# Altium schematic sheet 07 HDMI.SchDoc
size A3; Revision: V1.2; SheetNumber: 7; SheetTotal: 11
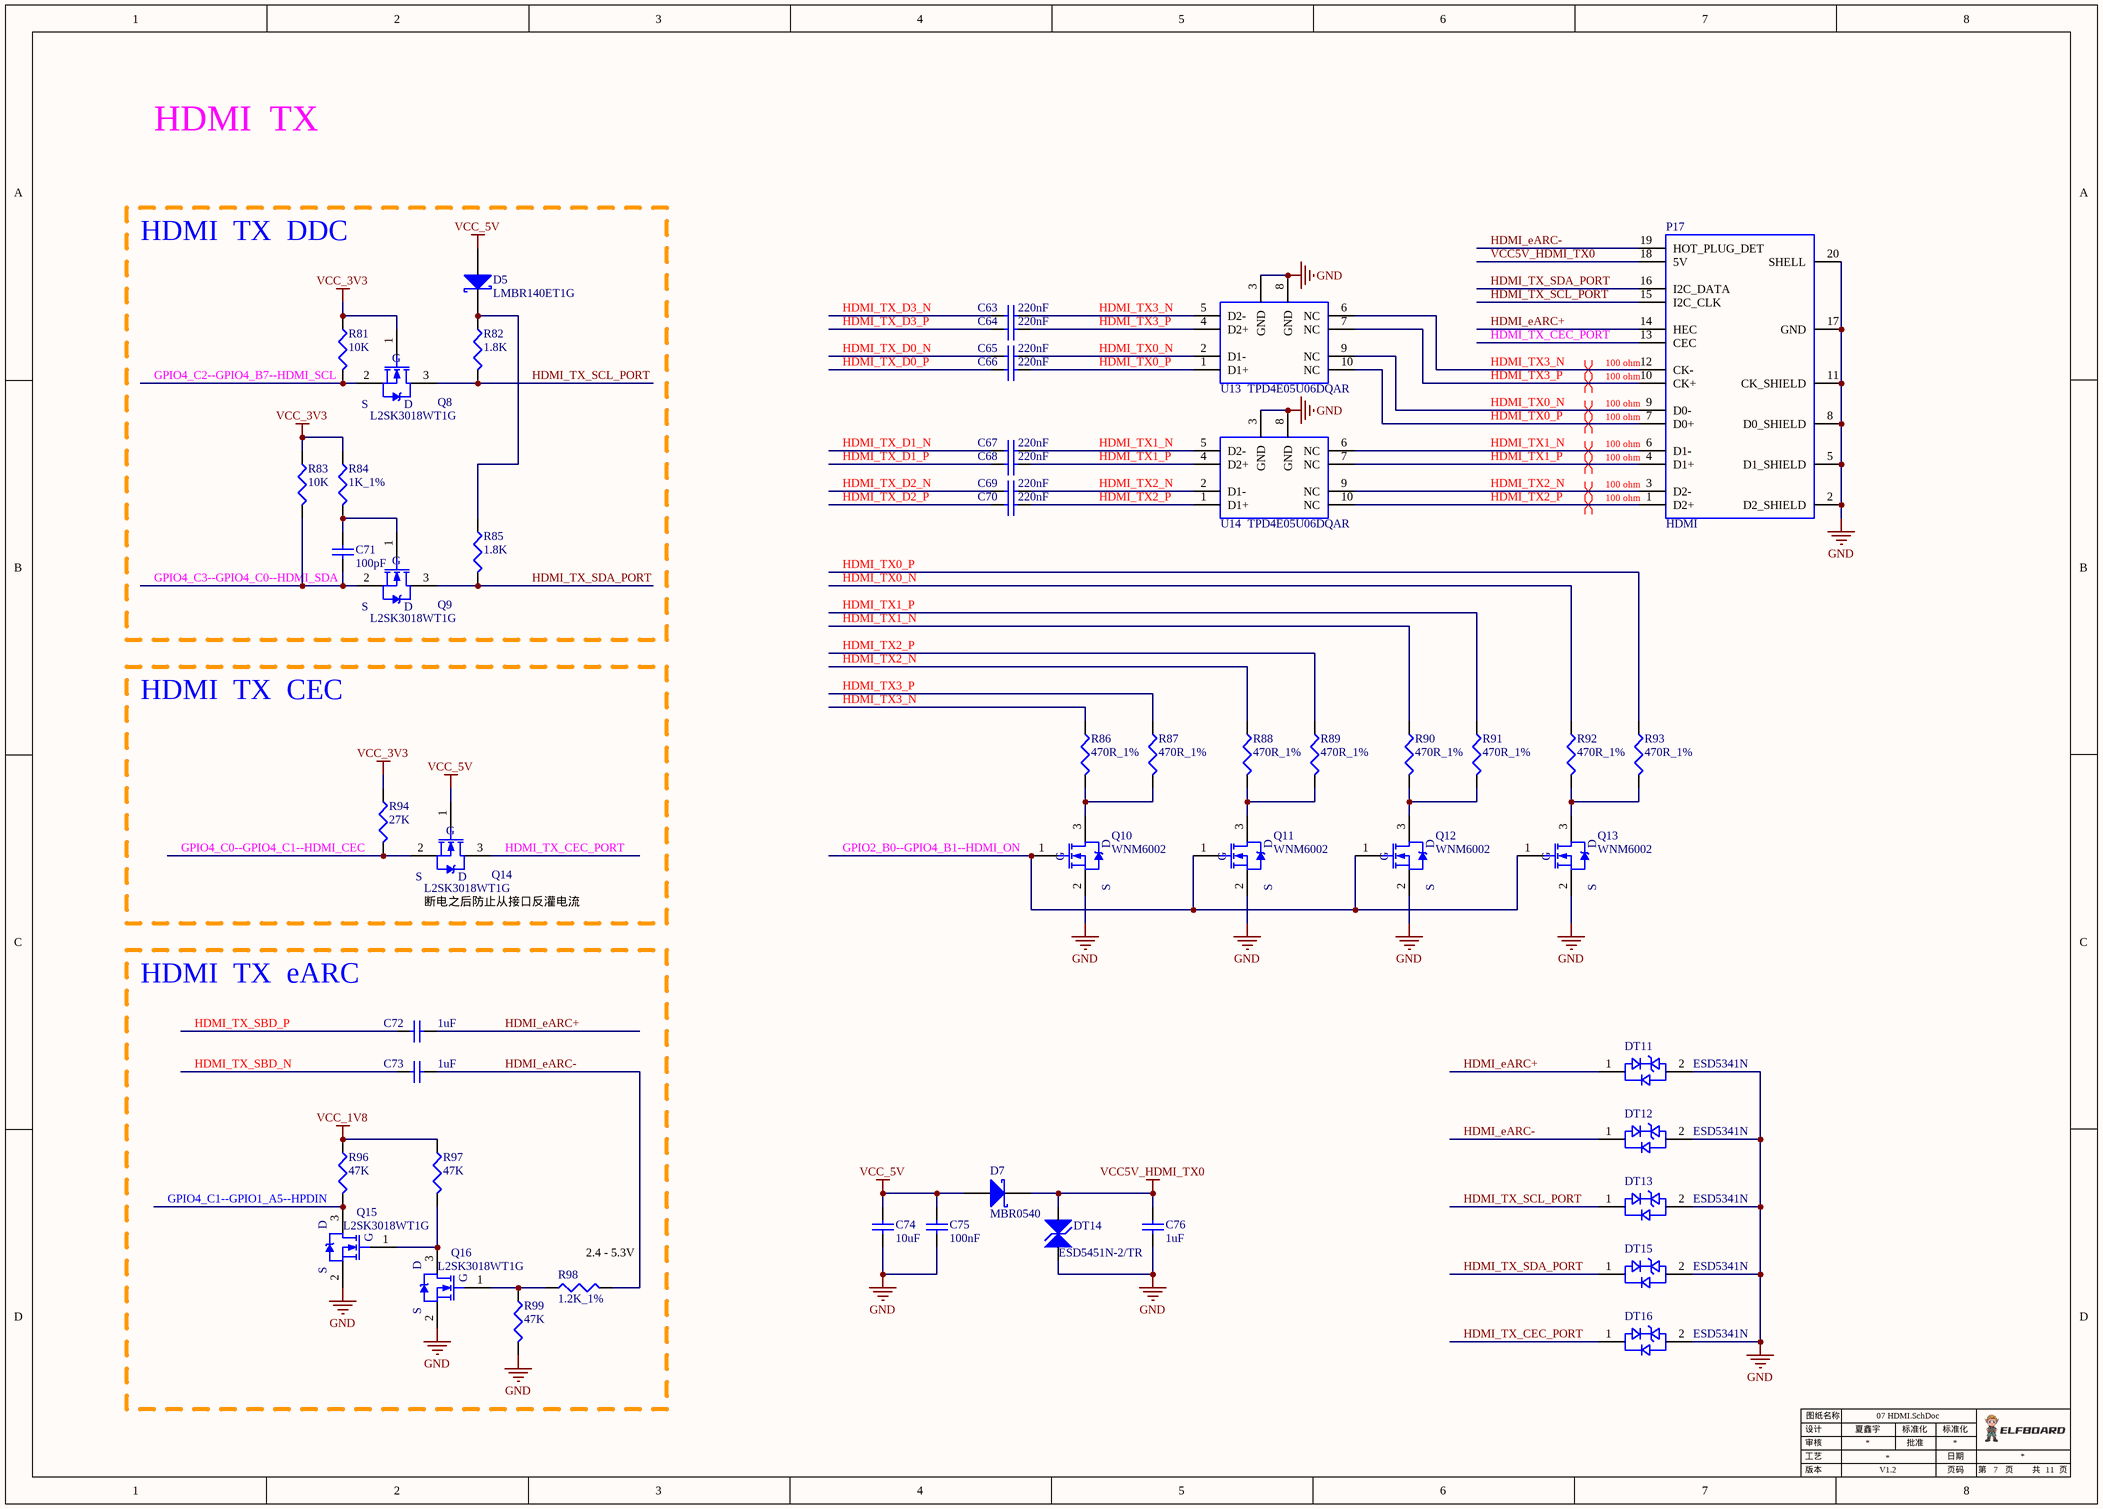
[diagram p0: 07 HDMI.SchDoc]

## Parts
C63  220nF  [0201C]
C64  220nF  [0201C]
C65  220nF  [0201C]
C66  220nF  [0201C]
C67  220nF  [0201C]
C68  220nF  [0201C]
C69  220nF  [0201C]
C70  220nF  [0201C]
C71  100pF  [0402C]
C72  1uF  [0201C]
C73  1uF  [0201C]
C74  10uF  [0603C]
C75  100nF  [0603C]
C76  1uF  [0402C]
D5  LMBR140ET1G  [SOD_323]
D7  MBR0540  [SOD_123]
DT11  ESD5341N  [0402TVS-ESD5341N]
DT12  ESD5341N  [0402TVS-ESD5341N]
DT13  ESD5341N  [0402TVS-ESD5341N]
DT14  ESD5451N-2/TR  [0402TVS]
DT15  ESD5341N  [0402TVS-ESD5341N]
DT16  ESD5341N  [0402TVS-ESD5341N]
P17  HDMI  [HDMI]
Q8  L2SK3018WT1G  [SOT323]
Q9  L2SK3018WT1G  [SOT323]
Q10  WNM6002  [SOT_323]
Q11  WNM6002  [SOT_323]
Q12  WNM6002  [SOT_323]
Q13  WNM6002  [SOT_323]
Q14  L2SK3018WT1G  [SOT323]
Q15  L2SK3018WT1G  [SOT323]
Q16  L2SK3018WT1G  [SOT323]
R81  10K  [0402R]
R82  1.8K  [0402R]
R83  10K  [0402R]
R84  1K_1%  [0402R]
R85  1.8K  [0402R]
R86  470R_1%  [0201R]
R87  470R_1%  [0201R]
R88  470R_1%  [0201R]
R89  470R_1%  [0201R]
R90  470R_1%  [0201R]
R91  470R_1%  [0201R]
R92  470R_1%  [0201R]
R93  470R_1%  [0201R]
R94  27K  [0402R]
R96  47K  [0402R]
R97  47K  [0402R]
R98  1.2K_1%  [0402R]
R99  47K  [0402R]
U13  TPD4E05U06DQAR  [USON-10]
U14  TPD4E05U06DQAR  [USON-10]

## Nets
GND: C74.1 C75.1 C76.1 DT11.2 DT12.2 DT13.2 DT14.1 DT15.2 DT16.2 P17.2(D2_SHIELD) P17.5(D1_SHIELD) P17.8(D0_SHIELD) P17.11(CK_SHIELD) P17.17(GND) P17.20(SHELL) Q10.2(S) Q11.2(S) Q12.2(S) Q13.2(S) Q15.2(S) Q16.2(S) R99.2 U13.3(GND) U13.8(GND) U14.3(GND) U14.8(GND)
VCC5V_HDMI_TX0: C76.2 D7.2(K) DT14.2 P17.18(5V)
VCC_1V8: R96.1 R97.1
VCC_3V3: Q8.1(G) R81.1 R83.1 R84.1 R94.1
VCC_5V: C74.2 C75.2 D5.1(A) D7.1(A) Q14.1(G)
GPIO2_B0--GPIO4_B1--HDMI_ON: Q10.1(G) Q11.1(G) Q12.1(G) Q13.1(G)
GPIO4_C0--GPIO4_C1--HDMI_CEC: Q14.2(S) R94.2
GPIO4_C1--GPIO1_A5--HPDIN: Q15.3(D) R96.2
GPIO4_C2--GPIO4_B7--HDMI_SCL: Q8.2(S) R81.2
GPIO4_C3--GPIO4_C0--HDMI_SDA: C71.1 Q9.2(S) R83.2
HDMI_eARC+: C72.2 DT11.1 P17.14(HEC)
HDMI_eARC-: C73.2 DT12.1 P17.19(HOT_PLUG_DET) R98.2
HDMI_TX0_N: C65.2 P17.9(D0-) R92.1 U13.2(D1-) U13.9(NC)
HDMI_TX0_P: C66.2 P17.7(D0+) R93.1 U13.1(D1+) U13.10(NC)
HDMI_TX1_N: C67.2 P17.6(D1-) R90.1 U14.5(D2-) U14.6(NC)
HDMI_TX1_P: C68.2 P17.4(D1+) R91.1 U14.4(D2+) U14.7(NC)
HDMI_TX2_N: C69.2 P17.3(D2-) R88.1 U14.2(D1-) U14.9(NC)
HDMI_TX2_P: C70.2 P17.1(D2+) R89.1 U14.1(D1+) U14.10(NC)
HDMI_TX3_N: C63.2 P17.12(CK-) R86.1 U13.5(D2-) U13.6(NC)
HDMI_TX3_P: C64.2 P17.10(CK+) R87.1 U13.4(D2+) U13.7(NC)
HDMI_TX_CEC_PORT: DT16.1 P17.13(CEC) Q14.3(D)
HDMI_TX_D0_N: C65.1
HDMI_TX_D0_P: C66.1
HDMI_TX_D1_N: C67.1
HDMI_TX_D1_P: C68.1
HDMI_TX_D2_N: C69.1
HDMI_TX_D2_P: C70.1
HDMI_TX_D3_N: C63.1
HDMI_TX_D3_P: C64.1
HDMI_TX_SBD_N: C73.1
HDMI_TX_SBD_P: C72.1
HDMI_TX_SCL_PORT: DT13.1 P17.15(I2C_CLK) Q8.3(D) R82.2
HDMI_TX_SDA_PORT: DT15.1 P17.16(I2C_DATA) Q9.3(D) R85.2
NetC71_2: C71.2 Q9.1(G) R84.2
NetD5_2: D5.2(K) R82.1 R85.1
NetQ10_3: Q10.3(D) R86.2 R87.2
NetQ11_3: Q11.3(D) R88.2 R89.2
NetQ12_3: Q12.3(D) R90.2 R91.2
NetQ13_3: Q13.3(D) R92.2 R93.2
NetQ15_1: Q15.1(G) Q16.3(D) R97.2
NetQ16_1: Q16.1(G) R98.1 R99.1

## Layout directives
differential pair; differential pair class 100 ohm: HDMI_TX0_N, HDMI_TX0_P, HDMI_TX1_N, HDMI_TX1_P, HDMI_TX2_N, HDMI_TX2_P, HDMI_TX3_N, HDMI_TX3_P

## Notes on the sheet
- HDMI  TX
- HDMI  TX  DDC
- HDMI  TX  CEC
- (near Q14) 断电之后防止从接口反灌电流
- HDMI  TX  eARC
- (near R98) 2.4 - 5.3V
- 设计
- 审核
- 工艺
- 图纸名称
- 夏鑫宇
- 批准
- 标准化
- 日期
- 版本
- 页码
- 第
- 页
- 共

## Library data of the parts
C63-C70 = 1110201001: 序号: 928; 存货名称: 贴装叠层陶瓷电容; 规格型号: 0201,220nF,6.3V,±20％,X5R; Published: 8-Jun-2000; LatestRevisionDate: 17-Jul-2002; LatestRevisionNote: Re-released for DXP Platform.; PackageReference: RAD-0.3; Publisher: Altium Limited; PackageDescription: Radial Cap, Thru-Hole; 2 Leads; 0.3 in Pin Spacing; Value: 220nF; 存货编码: 1110201001
C71 = 1110202016: 序号: 587; 存货名称: 贴装叠层陶瓷电容; 规格型号: 0402,100pF,50V,±5％,NPO; Published: 8-Jun-2000; LatestRevisionDate: 17-Jul-2002; LatestRevisionNote: Re-released for DXP Platform.; PackageReference: RAD-0.3; Publisher: Altium Limited; PackageDescription: Radial Cap, Thru-Hole; 2 Leads; 0.3 in Pin Spacing; Value: 100pF; 存货编码: 1110202016
C72 C73 = 1110201015: 存货名称: 贴装叠层陶瓷电容; 规格型号: 0201,1uF,10V,±20％,X5R; Published: 8-Jun-2000; LatestRevisionDate: 17-Jul-2002; LatestRevisionNote: Re-released for DXP Platform.; PackageReference: RAD-0.3; Publisher: Altium Limited; PackageDescription: Radial Cap, Thru-Hole; 2 Leads; 0.3 in Pin Spacing; Value: 1uF; 存货编码: 1110201015
C74 = 1110203058: 序号: 707; 存货名称: 贴装叠层陶瓷电容; 规格型号: 0603,10uF,10V,±10％,X5R; 禁用状态: 否; Published: 8-Jun-2000; LatestRevisionDate: 17-Jul-2002; LatestRevisionNote: Re-released for DXP Platform.; PackageReference: RAD-0.3; Publisher: Altium Limited; PackageDescription: Radial Cap, Thru-Hole; 2 Leads; 0.3 in Pin Spacing; Value: 10uF; 存货编码: 1110203058
C75 = 1110203001: 序号: 628; 存货名称: 贴装叠层陶瓷电容; 规格型号: 0603,100nF,50V,±10％,X7R; 禁用状态: 否; Published: 8-Jun-2000; LatestRevisionDate: 17-Jul-2002; LatestRevisionNote: Re-released for DXP Platform.; PackageReference: RAD-0.3; Publisher: Altium Limited; PackageDescription: Radial Cap, Thru-Hole; 2 Leads; 0.3 in Pin Spacing; Value: 100nF; 存货编码: 1110203001
C76 = 1110202021: 序号: 600; 存货名称: 贴装叠层陶瓷电容; 规格型号: 0402,1uF,16V,±10％,X5R; Published: 8-Jun-2000; LatestRevisionDate: 17-Jul-2002; LatestRevisionNote: Re-released for DXP Platform.; PackageReference: RAD-0.3; Publisher: Altium Limited; PackageDescription: Radial Cap, Thru-Hole; 2 Leads; 0.3 in Pin Spacing; Value: 1uF; 存货编码: 1110202021
D5 = 1110501064: 存货名称: 肖特基二极管; 规格型号: LMBR140ET1G,SOD323; Published: 8-Jun-2000; LatestRevisionDate: 17-Jul-2002; LatestRevisionNote: Re-released for DXP Platform.; PackageReference: SMB; Publisher: Altium Limited; PackageDescription: DO-214-AA/SMB; 2 C-Bend Leads; Body 5.3 x 3.6 mm, inc. leads (LxW); Code_JEDEC: DO-214-AA; 存货编码: 1110501064; Value: LMBR140ET1G
D7 = 1110501001: 序号: 2480; 存货名称: 肖特基二极管; 规格型号: MBR0540,SOD123; Published: 8-Jun-2000; LatestRevisionDate: 17-Jul-2002; LatestRevisionNote: Re-released for DXP Platform.; PackageReference: SMB; Publisher: Altium Limited; PackageDescription: DO-214-AA/SMB; 2 C-Bend Leads; Body 5.3 x 3.6 mm, inc. leads (LxW); Code_JEDEC: DO-214-AA; 存货编码: 1110501001; Value: MBR0540
DT11-DT13 DT15 DT16 = 1110503052: 序号: 4824; 存货名称: TVS管; 规格型号: ESD5341N-2/TR,0402TVS; value: ESD5341N-2/TR; 禁用状态: 否; 存货编码: 1110503052
DT14 = 1110503036: 存货名称: TVS管; 规格型号: ESD5451N-2/TR,DFN1006-2L; 禁用状态: 否; Value: ESD5451N-2/TR; 存货编码: 1110503036
P17 = 1120202041: 序号: 2494; 存货名称: 插装HDMI座; 规格型号: A型; 描述: FCI生产编号:10029449,001RLF,与1120202030通用; 禁用状态: 否; 存货编码: 1120202041; value: HDMI
Q8 Q9 Q14-Q16 = 1110505029: Note: Pin 2 is electrically connected to pin 4.; 序号: 4061; 存货名称: 场效应管; 规格型号: L2SK3018WT1G,SOT-323; 描述: 替代1110505016; 禁用状态: 否; Published: 8-Jun-2000; LatestRevisionDate: 17-Jul-2002; LatestRevisionNote: Re-released for DXP Platform.; DatasheetVersion: PD-9.814; PackageVersion: Feb-1997; PackageReference: TO-220AB; Publisher: Altium Limited; PackageDescription: TO, Thru-Hole, Vertical, Heatsink Mounted; 3 In-Line Leads; Pitch 2.54 mm; VALUE: L2SK3018WT1G; 存货编码: 1110505029
Q10-Q13 = 1110505033: Note: Pin 2 is electrically connected to pin 4.; 序号: 4825; 存货名称: 场效应管; 规格型号: WNM6002,SOT_323,N沟道; 禁用状态: 否; Published: 8-Jun-2000; LatestRevisionDate: 17-Jul-2002; LatestRevisionNote: Re-released for DXP Platform.; DatasheetVersion: PD-9.814; PackageVersion: Feb-1997; PackageReference: TO-220AB; Publisher: Altium Limited; PackageDescription: TO, Thru-Hole, Vertical, Heatsink Mounted; 3 In-Line Leads; Pitch 2.54 mm; VALUE: WNM6002; 存货编码: 1110505033
R81 R83 = 1110102007: 序号: 17; 存货名称: 贴装电阻; 规格型号: 0402,10K,±5％; Value: 10K; 存货编码: 1110102007
R82 R85 = 1110102185: 存货名称: 贴装电阻; 规格型号: 0402,1.8K,±5％; 描述栏信息: 厚声; Value: 1.8K; 存货编码: 1110102185
R84 = 1110102011: 序号: 21; 存货名称: 贴装电阻; 规格型号: 0402,1K,±1％; Value: 1K_1%; 存货编码: 1110102011
R86-R93 = 1110101007: 存货名称: 贴装电阻; 规格型号: 0201,470Ω,±1％; Value: 470R_1%; 存货编码: 1110101007
R94 = 1110102085: 序号: 119; 存货名称: 贴装电阻; 规格型号: 0402,27K,±5％; Value: 27K; 存货编码: 1110102085
R96 R97 R99 = 1110102040: 序号: 53; 存货名称: 贴装电阻; 规格型号: 0402,47K,±5％; Value: 47K; 存货编码: 1110102040
R98 = 1110102012: 序号: 22; 存货名称: 贴装电阻; 规格型号: 0402,1.2K,±1％; Value: 1.2K_1%; 存货编码: 1110102012
U13 U14 = 1110503037: 存货名称: TVS管; 规格型号: TPD4E05U06DQAR,USON; Value: TPD4E05U06DQAR; 存货编码: 1110503037